# Altium schematic sheet PAGE02_CONNECTOR.SchDoc
size 386 x 246 mm
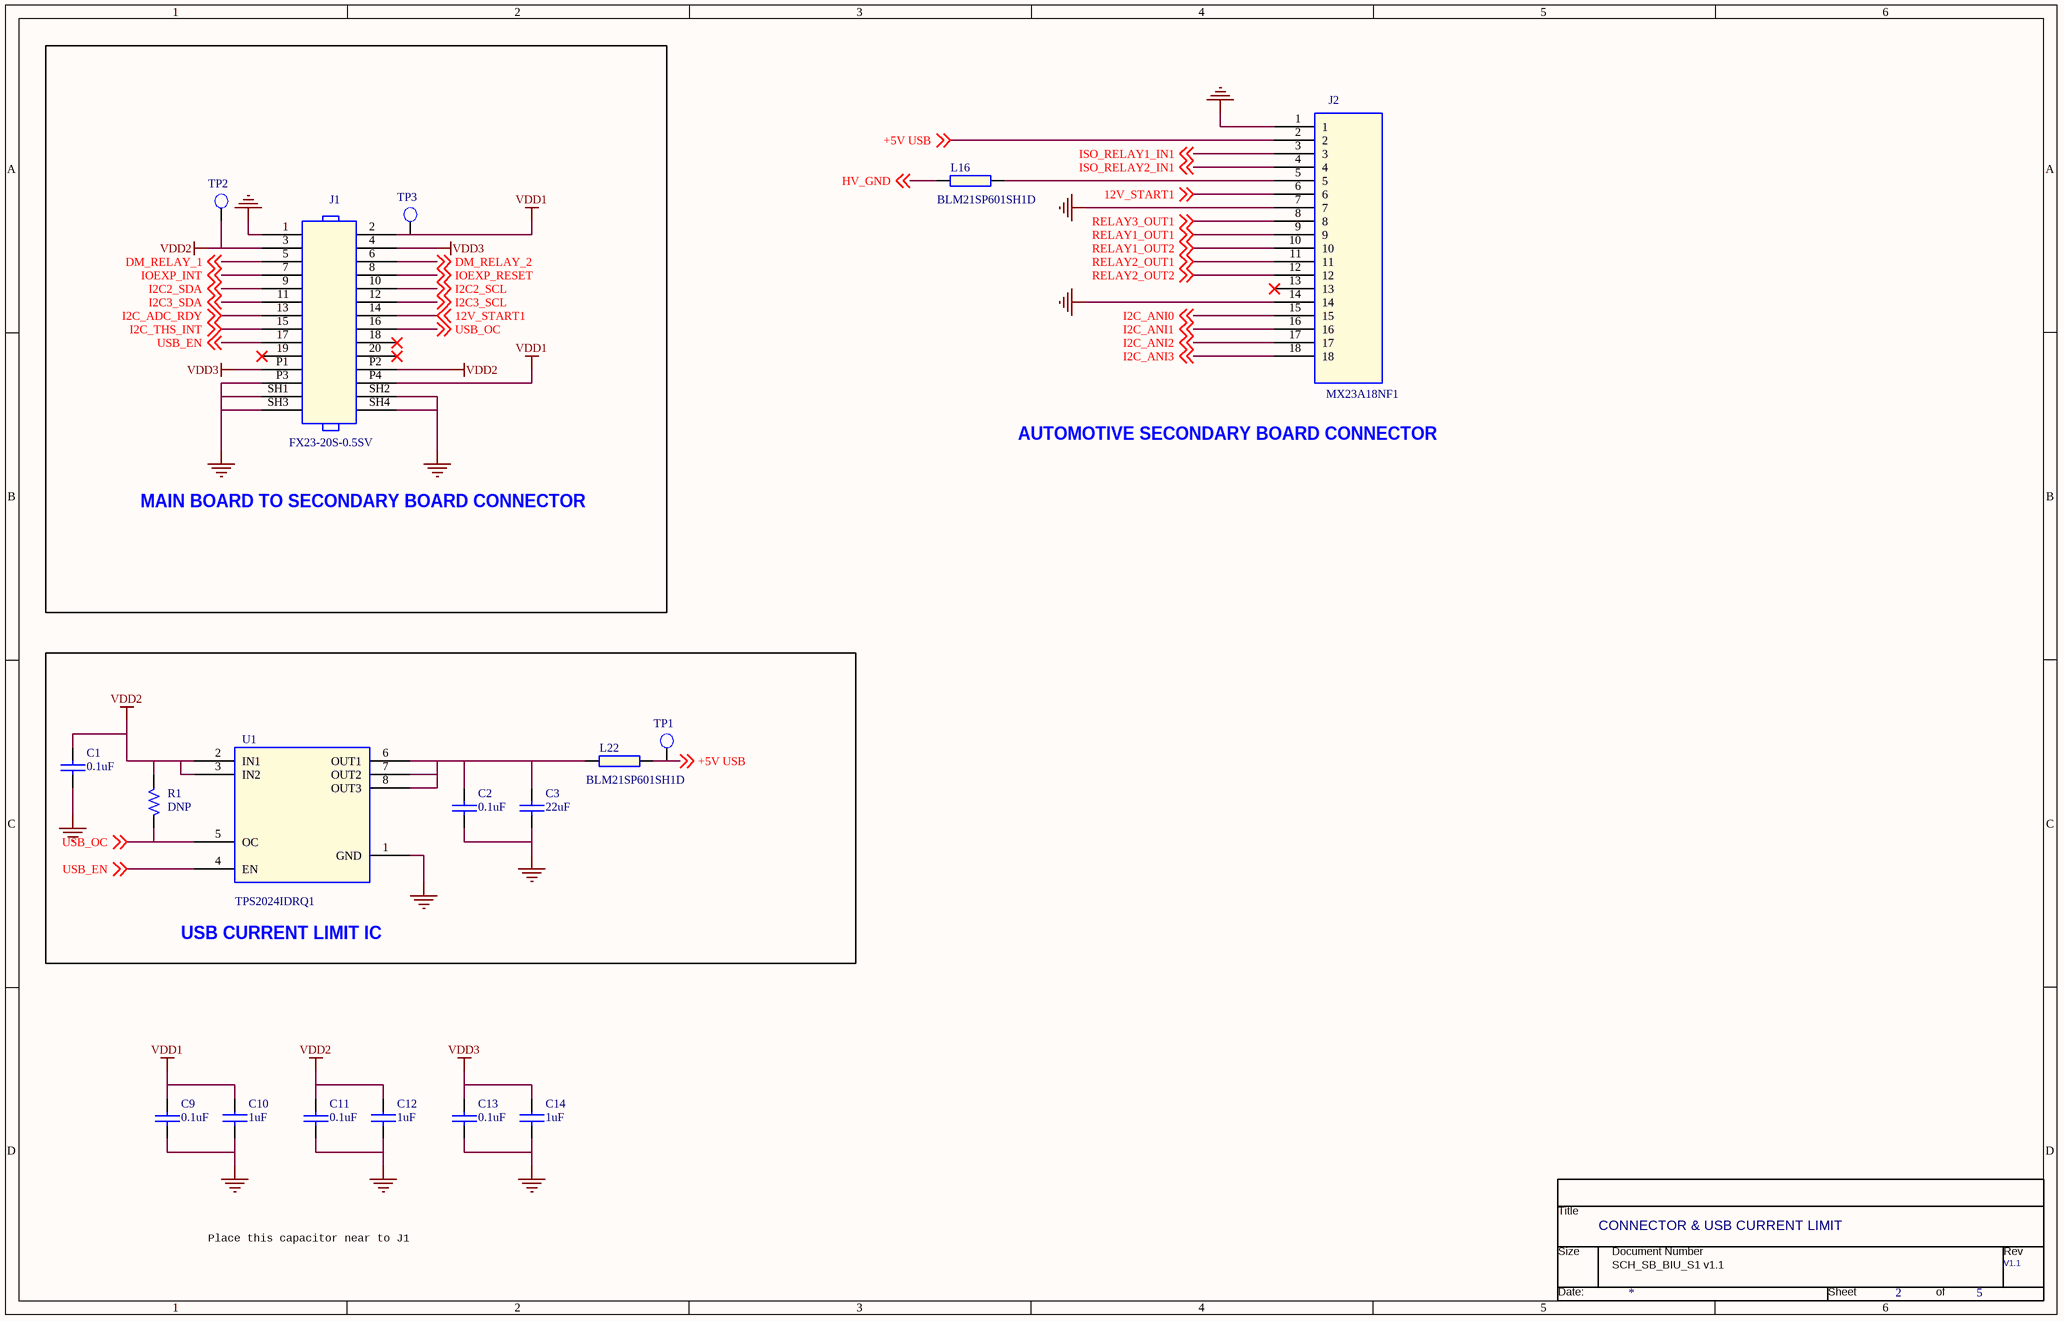
[diagram p0: PAGE02_CONNECTOR.SchDoc]

## Parts
*  Page Count: 5  Page Number: 2  Title: CONNECTOR & USB CURRENT LIMIT  RevCode: V1.1  (hidden comment: TitleBlock0)  (graphical)
C1  0.1uF  [CAPC1005X55N_A]
C2  0.1uF  [CAPC1005X55N_A]
C3  22uF  [CAPC1608X80N_A]
C9  0.1uF  [CAPC1005X55N_A]
C10  1uF  [CAPC1608X90N_A]
C11  0.1uF  [CAPC1005X55N_A]
C12  1uF  [CAPC1608X90N_A]
C13  0.1uF  [CAPC1005X55N_A]
C14  1uF  [CAPC1608X90N_A]
J1  FX23-20S-0.5SV  [HIROSE_FX23-20S-0P5SV]
J2  MX23A18NF1  [JAE_MX23A18NF1]
L16  BLM21SP601SH1D  [INDC1608X95N]
L22  BLM21SP601SH1D  [INDC1608X95N]
R1  DNP  [AX/RC05]
TP1  T POINT R  [TPC160H100]  (value not drawn)
TP2  T POINT R  [TPC160H100]  (value not drawn)
TP3  T POINT R  [TPC160H100]  (value not drawn)
U1  TPS2024IDRQ1  [SOIC127P600X175-8N_TI]

## Blocks framed on the sheet
MAIN BOARD TO SECONDARY BOARD CONNECTOR: J1 TP2 TP3
USB CURRENT LIMIT IC: C1-C3 L22 R1 TP1 U1

## Nets
GND: C1.2 C2.2 C3.2 C9.2 C10.2 C11.2 C12.2 C13.2 C14.2 J1.1 J1.P3 J1.SH1 J1.SH2 J1.SH3 J1.SH4 J2.1 J2.7 J2.14 U1.1(GND)
VDD1: C9.1 C10.1 J1.2 J1.P4 TP3.1(TP)
VDD2: C1.1 C11.1 C12.1 J1.3 J1.P2 R1.1 TP2.1(TP) U1.2(IN1) U1.3(IN2)
VDD3: C13.1 C14.1 J1.4 J1.P1
12V_START1: J1.14 J2.6 ; off-sheet 12V_START1
+5V USB: J2.2 L22.2 TP1.1(TP) ; off-sheet +5V USB
DM_RELAY_1: J1.5 ; off-sheet DM_RELAY_1
DM_RELAY_2: J1.6 ; off-sheet DM_RELAY_2
HV_GND: L16.1 ; off-sheet HV_GND
I2C2_SCL: J1.10 ; off-sheet I2C2_SCL
I2C2_SDA: J1.9 ; off-sheet I2C2_SDA
I2C3_SCL: J1.12 ; off-sheet I2C3_SCL
I2C3_SDA: J1.11 ; off-sheet I2C3_SDA
I2C_ADC_RDY: J1.13 ; off-sheet I2C_ADC_RDY
I2C_ANI0: J2.15 ; off-sheet I2C_ANI0
I2C_ANI1: J2.16 ; off-sheet I2C_ANI1
I2C_ANI2: J2.17 ; off-sheet I2C_ANI2
I2C_ANI3: J2.18 ; off-sheet I2C_ANI3
I2C_THS_INT: J1.15 ; off-sheet I2C_THS_INT
IOEXP_INT: J1.7 ; off-sheet IOEXP_INT
IOEXP_RESET: J1.8 ; off-sheet IOEXP_RESET
ISO_RELAY1_IN1: J2.3 ; off-sheet ISO_RELAY1_IN1
ISO_RELAY2_IN1: J2.4 ; off-sheet ISO_RELAY2_IN1
RELAY1_OUT1: J2.9 ; off-sheet RELAY1_OUT1
RELAY1_OUT2: J2.10 ; off-sheet RELAY1_OUT2
RELAY2_OUT1: J2.11 ; off-sheet RELAY2_OUT1
RELAY2_OUT2: J2.12 ; off-sheet RELAY2_OUT2
RELAY3_OUT1: J2.8 ; off-sheet RELAY3_OUT1
USB_EN: J1.17 U1.4(EN) ; off-sheet USB_EN
USB_OC: J1.16 R1.2 U1.5(OC) ; off-sheet USB_OC
NetC2_1: C2.1 C3.1 L22.1 U1.6(OUT1) U1.7(OUT2) U1.8(OUT3)
NetJ2_5: J2.5 L16.2

Not connected (* = marked no-connect by the designer): J1 18(9)* 19(22)* 20(10)*; J2 13*

## Notes on the sheet
- AUTOMOTIVE SECONDARY BOARD CONNECTOR
- Place this capacitor near to J1
- SCH_SB_BIU_S1 v1.1
- (in symbol TitleBlock0) Title; Size; Document Number; Rev; Date:; Sheet; of

## Library data of the parts
* = TitleBlock0: Page Size: A; Page Create Date: March  8, 1995; Page Modify Date: *
C1 C2 C9 C11 C13 = CAP_NP_78: CAP CER 0.1uF 16V 10% X7R 0402; Manufacturer: MURATA; Manufacturere's P/N: GRM155R71C104KA88J; CLASS: DISCRETE; SIGNAL_MODEL: DEFAULT_CAPACITOR_100000pF_2_1; AGILE_PN: 150-75182; CAD_APPROVED: Yes; FPLIST: CC0402_25,CC0402_HD,0402_CC; WVDC: 16V; Tolerance: 10%; ROHS: Yes; HEIGHT: 0.635MM; TOL: 10%; PCB Footprint: CAPC1005X55N_A
  C1 C2: package: 0402
  C9 C11 C13: Package: 0402
C3 = CAP_NP_78: MLCC - SMD/SMT 22uF+/-20% 16V X5R; Manufacturer: SAMSUNG ELECTRO; Manufacturere's P/N: CL10A226MO7JZNC; CLASS: DISCRETE; SIGNAL_MODEL: DEFAULT_CAPACITOR_100000pF_2_1; AGILE_PN: 150-75182; CAD_APPROVED: Yes; FPLIST: CC0402_25,CC0402_HD,0402_CC; package: 0603; WVDC: 16V; ROHS: Yes; PCB Footprint: CAPC1608X80N_A
C10 C12 C14 = CAP NP: CAP CER 1uF 25V 10% X7R 0603; Manufacturer: TDK; Manufacturere's P/N: CGA3E1X7R1E105K080AC; Package: 0603; PCB Footprint: CAPC1608X90N_A
J1 = CONN PCB 12x2-P_1: Manufacturere's P/N: FX23-20S-0.5SV; Manufacturer Part Number: FX23-20S-0.5SV; PCB Footprint: HIROSE_FX23-20S-0P5SV
J2 = MX23A18NF1_0: CONN HEADER R/A 18POS 2.5MM; Manufacturer: JAE Electronics; PCB Footprint: JAE_MX23A18NF1; Manufacturer Part Number: MX23A18NF1; Manufacturere's P/N: MX23A18NF1
L16 L22 = L-33R100MHz-3A-25%-0603: FERRITEBEAD SMD Z100MHZ=600OHM 2; Manufacturer: Murata Electronics; Tolerance: 25%; Rating: 3A; PCB Footprint: INDC2012X105N; User_Value: BLM21SP601SH1D; Manufacturere's P/N: BLM21SP601SH1D; Manufacturer Part Number: BLM21SP601SH1D; Package: 0805
R1 = R_0: RES SMD 10K OHM 1% 1/10W 0603; Manufacturer Part Number: RCA060310K0FKEA; Manufacturer: Vishay Dale; TC2: 0; POWER: RMAX; MAX_TEMP: RTMAX; SLOPE: RSMAX; VOLTAGE: RVMAX; PSpiceTemplate: R^@REFDES %1 %2 ?TOLERANCE|R^@REFDES| @VALUE TC=@TC1,@TC2 ?TOLERANCE|\n.model R^@REFDES RES R=1 DEV=@TOLERANCE%|; DIST: FLAT; PCB Footprint: RESC1608X55N_B; TC1: 0; TOLERANCE: 1%; Manufacturere's P/N: RCA060310K0FKEA; Package: 0603; Value: DNP
U1 = TPS2024IDRQ1_0: Power Switch ICs - Power Distribution Auto Cat Pwr-Dist Sw; Manufacturer: TI; Package: SOIC-8; Manufacturere's P/N: TPS2024IDRQ1; PCB Footprint: SOIC127P600X175-8N_TI
TP1-TP3 = T POINT R: PCB Footprint: TPC160H100